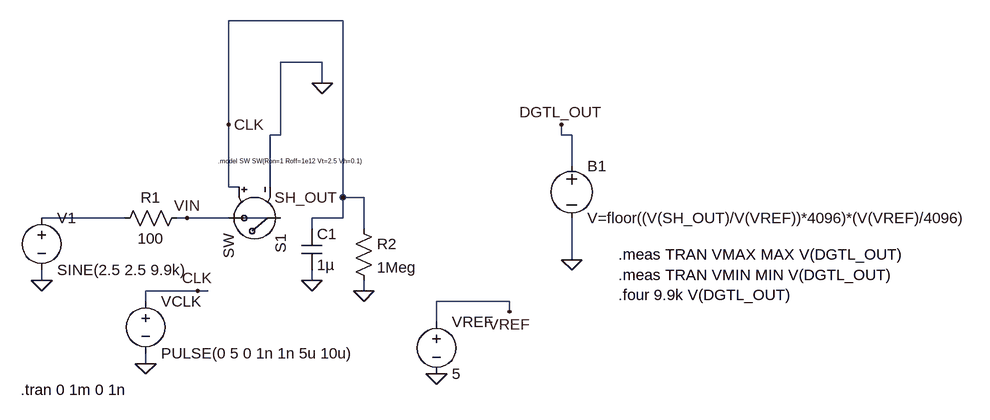
[diagram p0: schematic SRS_!.asc]
SRS_!.asc, the LTspice schematic file:
Version 4.1
SHEET 1 1704 680
WIRE 432 -256 256 -256
WIRE 400 -192 336 -192
WIRE 400 -160 400 -192
WIRE 256 -96 256 -256
WIRE 336 -80 336 -192
WIRE 336 -80 320 -80
WIRE 768 -80 768 -96
WIRE 784 -80 768 -80
WIRE 784 -32 784 -80
WIRE 256 0 256 -96
WIRE 272 0 256 0
WIRE 320 0 320 -80
WIRE 432 16 432 -256
WIRE 464 16 432 16
WIRE 96 48 -32 48
WIRE 192 48 176 48
WIRE 256 48 192 48
WIRE 336 48 272 48
WIRE 432 48 432 16
WIRE 432 48 384 48
WIRE 384 64 384 48
WIRE 464 64 464 16
WIRE 784 112 784 48
WIRE -32 144 -32 128
WIRE 384 144 384 128
WIRE 208 160 128 160
WIRE 224 160 208 160
WIRE 464 160 464 144
WIRE 128 176 128 160
WIRE 688 176 576 176
WIRE 688 192 688 176
WIRE 576 208 576 176
WIRE 128 272 128 256
FLAG 192 48 VIN
FLAG 384 144 0
FLAG 464 160 0
FLAG 768 -96 DGTL_OUT
FLAG -32 144 0
FLAG 208 160 CLK
FLAG 576 288 0
FLAG 432 16 SH_OUT
FLAG 128 272 0
FLAG 256 -96 CLK
FLAG 400 -160 0
FLAG 688 192 VREF
FLAG 784 112 0
SYMBOL voltage -32 32 R0
SYMATTR InstName V1
SYMATTR Value SINE(2.5 2.5 9.9k)
SYMBOL res 192 32 R90
WINDOW 0 0 56 VBottom 2
WINDOW 3 32 56 VTop 2
SYMATTR InstName R1
SYMATTR Value 100
SYMBOL lib\\sym\\sw 352 48 R90
SYMATTR InstName S1
SYMBOL cap 368 64 R0
SYMATTR InstName C1
SYMATTR Value 1µ
SYMBOL res 448 48 R0
SYMATTR InstName R2
SYMATTR Value 1Meg
SYMBOL voltage 128 160 R0
SYMATTR InstName VCLK
SYMATTR Value PULSE(0 5 0 1n 1n 5u 10u)
SYMBOL voltage 576 192 R0
WINDOW 123 0 0 Left 0
WINDOW 39 0 0 Left 0
SYMATTR InstName VREF
SYMATTR Value 5
SYMBOL lib\\sym\\bv 784 -48 R0
SYMATTR InstName B1
SYMATTR Value V=floor((V(SH_OUT)/V(VREF))*4096)*(V(VREF)/4096)
TEXT -64 312 Left 2 !.tran 0 1m 0 1n
TEXT 240 -40 Left 0 !.model SW SW(Ron=1 Roff=1e12 Vt=2.5 Vh=0.1)
TEXT 856 104 Left 2 !.meas TRAN VMAX MAX V(DGTL_OUT)\n.meas TRAN VMIN MIN V(DGTL_OUT)\n.four 9.9k V(DGTL_OUT)

The netlist it stands for:
* SRS_!.asc
V1 N001 0 SINE(2.5 2.5 9.9k)
R1 VIN N001 100
S1 N002 VIN SH_OUT 0 SW
C1 SH_OUT 0 1µ
R2 SH_OUT 0 1Meg
VCLK SH_OUT 0 PULSE(0 5 0 1n 1n 5u 10u)
VREF VREF 0 5
B1 DGTL_OUT 0 V=floor((V(SH_OUT)/V(VREF))*4096)*(V(VREF)/4096)
.tran 0 1m 0 1n
.model SW SW(Ron=1 Roff=1e12 Vt=2.5 Vh=0.1)
.meas TRAN VMAX MAX V(DGTL_OUT)
.meas TRAN VMIN MIN V(DGTL_OUT)
.four 9.9k V(DGTL_OUT)
.backanno
.end